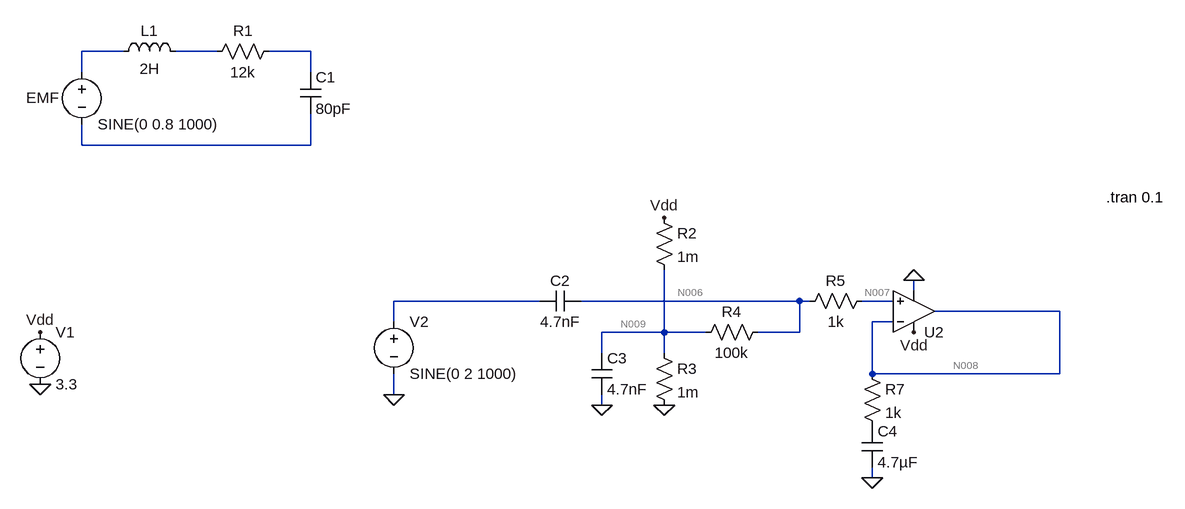
[diagram p0: schematic AnalogFrontend.asc]
AnalogFrontend.asc, the LTspice schematic file:
Version 4.1
SHEET 1 1632 680
WIRE -64 -320 -128 -320
WIRE 80 -320 16 -320
WIRE 224 -320 160 -320
WIRE -128 -288 -128 -320
WIRE 224 -288 224 -320
WIRE -128 -176 -128 -208
WIRE 224 -176 224 -224
WIRE 224 -176 -128 -176
WIRE 1152 48 1152 32
WIRE 576 64 352 64
WIRE 976 64 640 64
WIRE 992 64 976 64
WIRE 1120 64 1072 64
WIRE 1376 80 1184 80
WIRE 352 96 352 64
WIRE 1120 96 1088 96
WIRE 768 112 768 16
WIRE 768 112 672 112
WIRE 832 112 768 112
WIRE 976 112 976 64
WIRE 976 112 912 112
WIRE 672 144 672 112
WIRE 768 144 768 112
WIRE 1088 176 1088 96
WIRE 1376 176 1376 80
WIRE 1376 176 1088 176
WIRE 352 208 352 176
WIRE 672 224 672 208
WIRE 1088 336 1088 320
FLAG -192 192 0
FLAG -192 112 Vdd
FLAG 1152 112 Vdd
FLAG 1152 32 0
FLAG 672 224 0
FLAG 768 224 0
FLAG 768 -64 Vdd
FLAG 1088 336 0
FLAG 352 208 0
SYMBOL voltage -128 -304 R0
WINDOW 0 -86 55 Left 2
WINDOW 123 0 0 Left 0
WINDOW 39 0 0 Left 0
SYMATTR InstName EMF
SYMATTR Value SINE(0 0.8 1000)
SYMBOL ind -80 -304 R270
WINDOW 0 32 56 VTop 2
WINDOW 3 5 56 VBottom 2
SYMATTR InstName L1
SYMATTR Value 2H
SYMBOL res 176 -336 R90
WINDOW 0 0 56 VBottom 2
WINDOW 3 32 56 VTop 2
SYMATTR InstName R1
SYMATTR Value 12k
SYMBOL cap 208 -288 R0
SYMATTR InstName C1
SYMATTR Value 80pF
SYMBOL voltage -192 96 R0
SYMATTR InstName V1
SYMATTR Value 3.3
SYMBOL cap 640 48 R90
WINDOW 0 0 32 VBottom 2
WINDOW 3 32 32 VTop 2
SYMATTR InstName C2
SYMATTR Value 4.7nF
SYMBOL res 752 -80 R0
SYMATTR InstName R2
SYMATTR Value 1m
SYMBOL res 752 128 R0
SYMATTR InstName R3
SYMATTR Value 1m
SYMBOL cap 656 144 R0
SYMATTR InstName C3
SYMATTR Value 4.7nF
SYMBOL res 928 96 R90
WINDOW 0 0 56 VBottom 2
WINDOW 3 32 56 VTop 2
SYMATTR InstName R4
SYMATTR Value 100k
SYMBOL res 1088 48 R90
WINDOW 0 0 56 VBottom 2
WINDOW 3 32 56 VTop 2
SYMATTR InstName R5
SYMATTR Value 1k
SYMBOL cap 1072 256 R0
SYMATTR InstName C4
SYMATTR Value 4.7µF
SYMBOL res 1072 160 R0
SYMATTR InstName R7
SYMATTR Value 1k
SYMBOL voltage 352 80 R0
WINDOW 123 0 0 Left 0
WINDOW 39 0 0 Left 0
SYMATTR InstName V2
SYMATTR Value SINE(0 2 1000)
SYMBOL OpAmps\\UniversalOpAmp 1152 80 M180
SYMATTR InstName U2
TEXT 1448 -96 Left 2 !.tran 0.1

The netlist it stands for:
* AnalogFrontend.asc
V§EMF N001 N004 SINE(0 0.8 1000)
L1 N001 N002 2H
R1 N003 N002 12k
C1 N003 N004 80pF
V1 Vdd 0 3.3
C2 N006 N005 4.7nF
R2 Vdd N009 1m
R3 N009 0 1m
C3 N009 0 4.7nF
R4 N006 N009 100k
R5 N007 N006 1k
C4 P001 0 4.7µF
R7 N008 P001 1k
V2 N005 0 SINE(0 2 1000)
X§U2 N007 N008 Vdd 0 N008 level1 Avol=1Meg GBW=10Meg Vos=0 En=0 Enk=0 In=0 Ink=0 Rin=500Meg  ; pins In+ In- V+ V- OUT
.tran 0.1
.lib UniversalOpAmp1.lib
.backanno
.end

* Results of the author's LTspice run, read from the files saved beside the schematic
* Operating Point, zero values left out:
*   V(n006) = 1.65 V
*   V(n007) = 1.65 V
*   V(n008) = 1.65 V
*   V(n009) = 1.65 V
*   V(p001) = 1.65 V
*   V(vdd) = 3.3 V
*   I(R2) = 1.65 kA
*   I(R3) = 1.65 kA
*   I(V1) = -1.65 kA
*   Ix(u2:3) = 3.3 nA
*   Ix(u2:4) = -3.3 nA
*   Ix(u2:5) = 1.19 nA
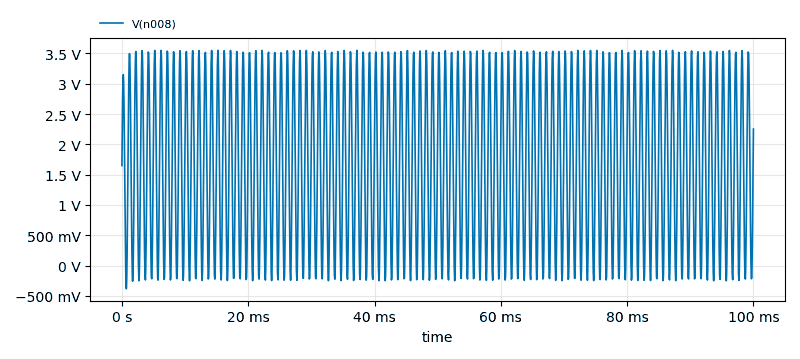
[diagram p1: Transient Analysis of AnalogFrontend.asc, plotted from the saved traces]
* Transient Analysis, 1 run:
*   V(n008): min -382.5 mV, max 3.55 V, average 1.647 V, rms 2.124 V, last 2.253 V